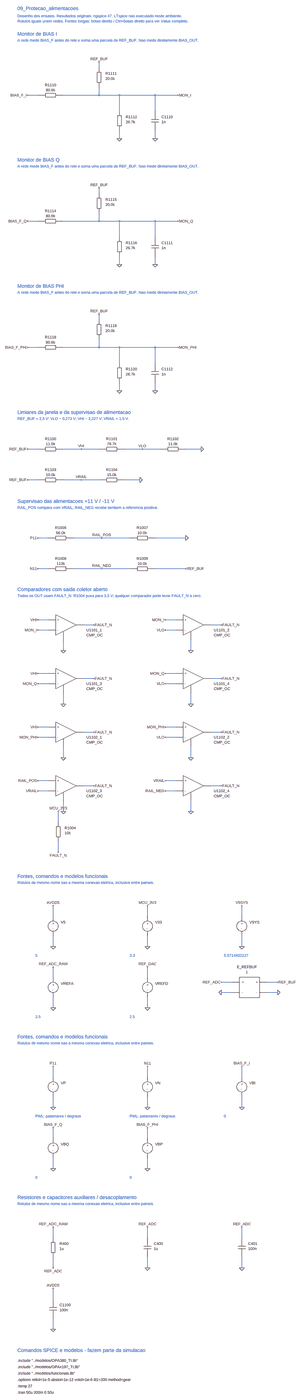
[diagram p0: schematic 09_Protecao_alimentacoes.asc, whole sheet]
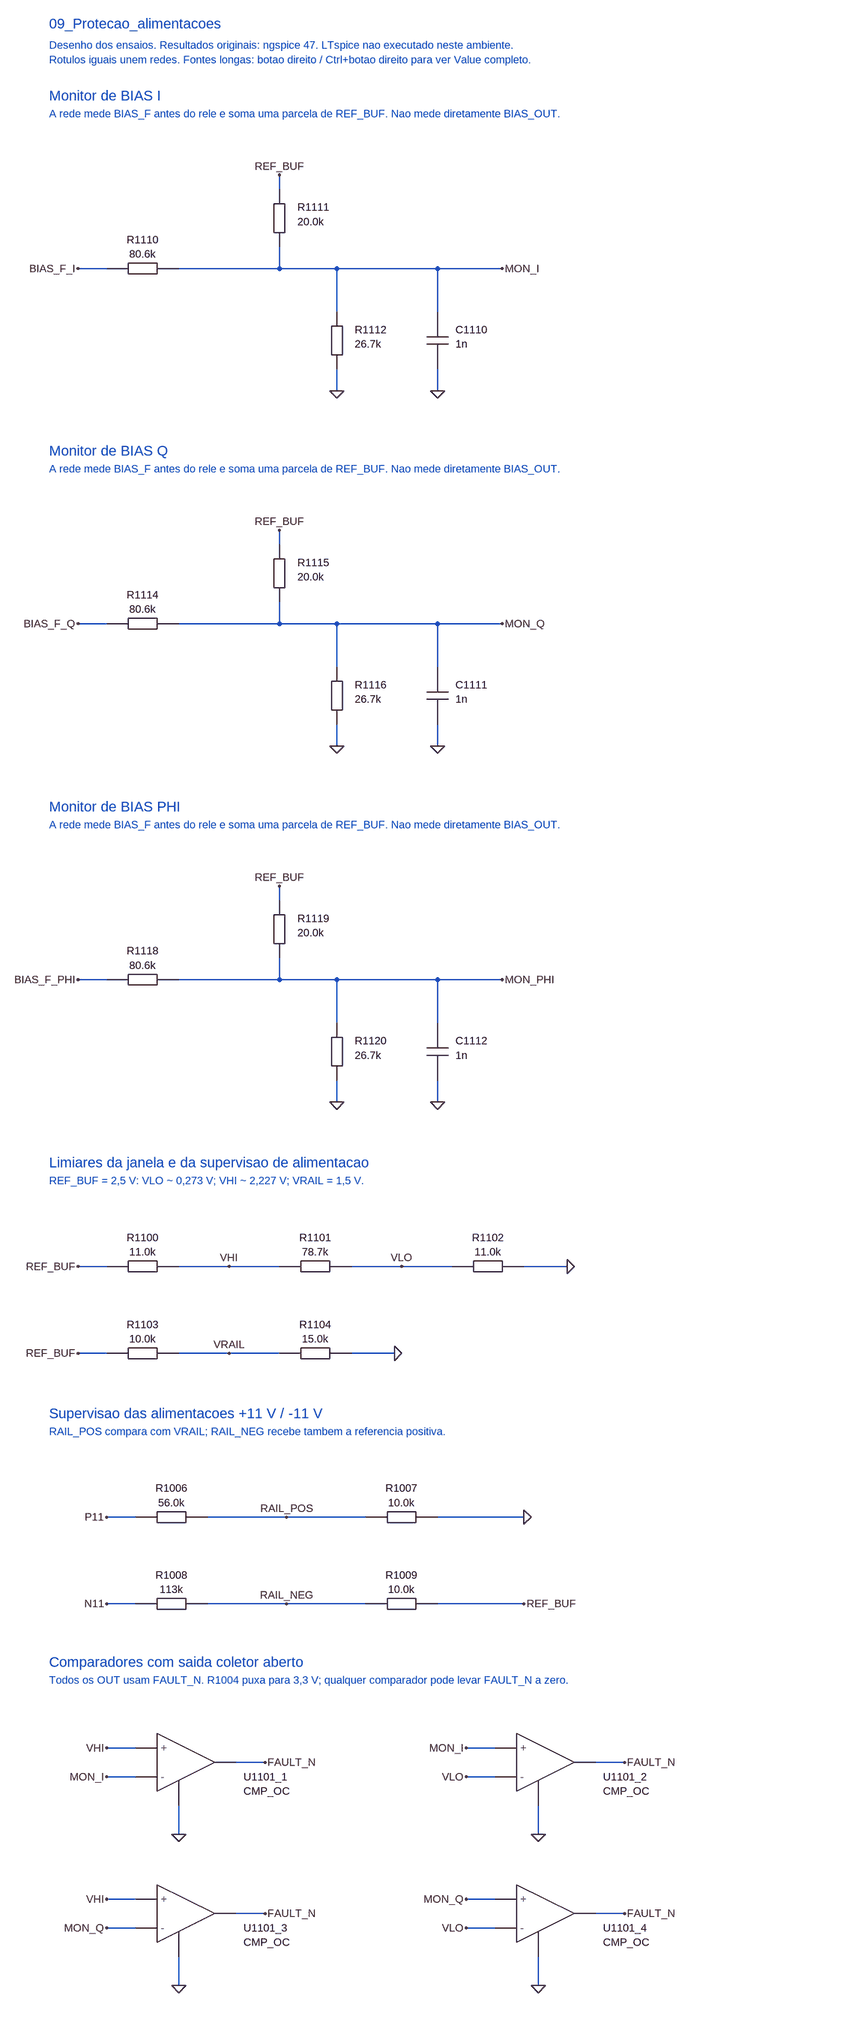
[diagram p1: schematic 09_Protecao_alimentacoes.asc, part, row 1 of 2, column 1 of 1]
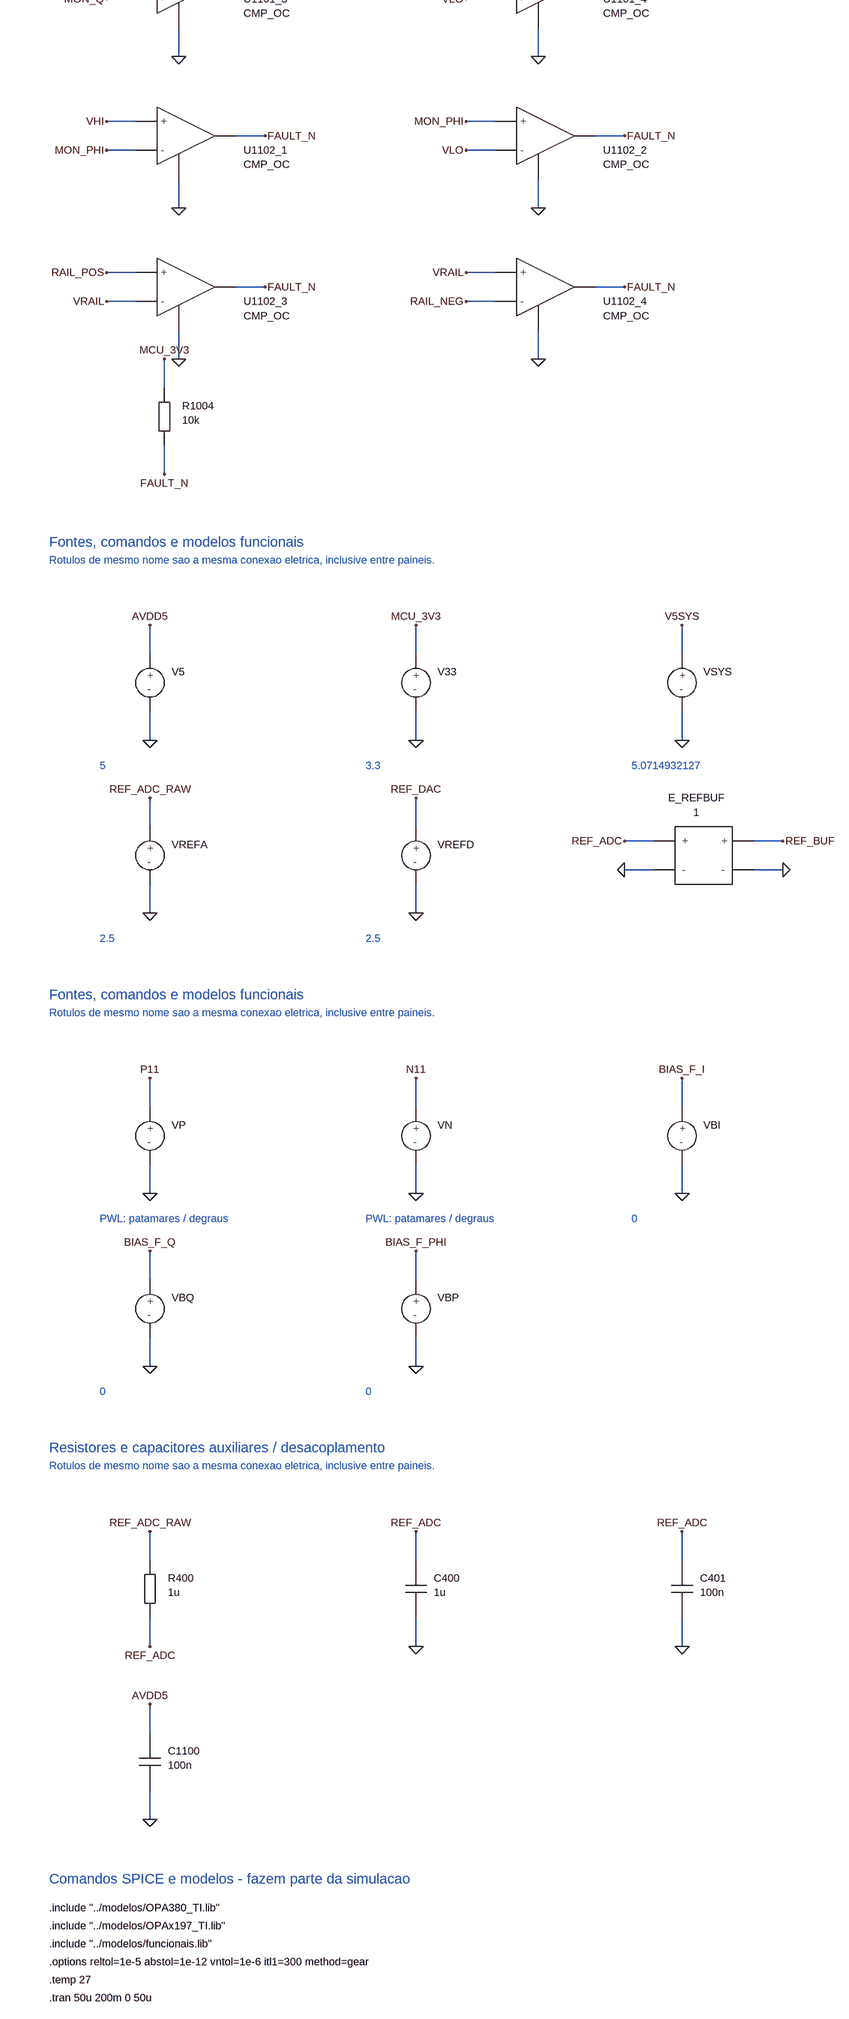
[diagram p2: schematic 09_Protecao_alimentacoes.asc, part, row 2 of 2, column 1 of 1]
09_Protecao_alimentacoes.asc, the LTspice schematic file:
Version 4.1
SHEET 1 1968 10640
TEXT 64 32 Left 3 ;09_Protecao_alimentacoes
TEXT 64 80 Left 2 ;Desenho dos ensaios. Resultados originais: ngspice 47. LTspice nao executado neste ambiente.
TEXT 64 112 Left 2 ;Rotulos iguais unem redes. Fontes longas: botao direito / Ctrl+botao direito para ver Value completo.
TEXT 64 192 Left 3 ;Monitor de BIAS I
TEXT 64 232 Left 2 ;A rede mede BIAS_F antes do rele e soma uma parcela de REF_BUF. Nao mede diretamente BIAS_OUT.
WIRE 192 576 128 576
WIRE 352 576 1072 576
WIRE 576 400 576 368
WIRE 576 528 576 576
WIRE 704 576 704 672
WIRE 704 800 704 848
WIRE 928 576 928 672
WIRE 928 800 928 848
FLAG 128 576 BIAS_F_I
FLAG 1072 576 MON_I
FLAG 576 368 REF_BUF
FLAG 704 848 0
FLAG 928 848 0
SYMBOL CV_RH 192 576 R0
SYMATTR InstName R1110
SYMATTR Value 80.6k
SYMBOL CV_RV 576 400 R0
SYMATTR InstName R1111
SYMATTR Value 20.0k
SYMBOL CV_RV 704 672 R0
SYMATTR InstName R1112
SYMATTR Value 26.7k
SYMBOL CV_CV 928 672 R0
SYMATTR InstName C1110
SYMATTR Value 1n
TEXT 64 1088 Left 3 ;Monitor de BIAS Q
TEXT 64 1128 Left 2 ;A rede mede BIAS_F antes do rele e soma uma parcela de REF_BUF. Nao mede diretamente BIAS_OUT.
WIRE 192 1472 128 1472
WIRE 352 1472 1072 1472
WIRE 576 1296 576 1264
WIRE 576 1424 576 1472
WIRE 704 1472 704 1568
WIRE 704 1696 704 1744
WIRE 928 1472 928 1568
WIRE 928 1696 928 1744
FLAG 128 1472 BIAS_F_Q
FLAG 1072 1472 MON_Q
FLAG 576 1264 REF_BUF
FLAG 704 1744 0
FLAG 928 1744 0
SYMBOL CV_RH 192 1472 R0
SYMATTR InstName R1114
SYMATTR Value 80.6k
SYMBOL CV_RV 576 1296 R0
SYMATTR InstName R1115
SYMATTR Value 20.0k
SYMBOL CV_RV 704 1568 R0
SYMATTR InstName R1116
SYMATTR Value 26.7k
SYMBOL CV_CV 928 1568 R0
SYMATTR InstName C1111
SYMATTR Value 1n
TEXT 64 1984 Left 3 ;Monitor de BIAS PHI
TEXT 64 2024 Left 2 ;A rede mede BIAS_F antes do rele e soma uma parcela de REF_BUF. Nao mede diretamente BIAS_OUT.
WIRE 192 2368 128 2368
WIRE 352 2368 1072 2368
WIRE 576 2192 576 2160
WIRE 576 2320 576 2368
WIRE 704 2368 704 2464
WIRE 704 2592 704 2640
WIRE 928 2368 928 2464
WIRE 928 2592 928 2640
FLAG 128 2368 BIAS_F_PHI
FLAG 1072 2368 MON_PHI
FLAG 576 2160 REF_BUF
FLAG 704 2640 0
FLAG 928 2640 0
SYMBOL CV_RH 192 2368 R0
SYMATTR InstName R1118
SYMATTR Value 80.6k
SYMBOL CV_RV 576 2192 R0
SYMATTR InstName R1119
SYMATTR Value 20.0k
SYMBOL CV_RV 704 2464 R0
SYMATTR InstName R1120
SYMATTR Value 26.7k
SYMBOL CV_CV 928 2464 R0
SYMATTR InstName C1112
SYMATTR Value 1n
TEXT 64 2880 Left 3 ;Limiares da janela e da supervisao de alimentacao
TEXT 64 2920 Left 2 ;REF_BUF = 2,5 V: VLO ~ 0,273 V; VHI ~ 2,227 V; VRAIL = 1,5 V.
WIRE 192 3232 128 3232
WIRE 352 3232 576 3232
WIRE 736 3232 960 3232
WIRE 1120 3232 1216 3232
WIRE 192 3520 128 3520
WIRE 352 3520 576 3520
WIRE 736 3520 832 3520
FLAG 128 3232 REF_BUF
FLAG 464 3232 VHI
FLAG 848 3232 VLO
FLAG 1216 3232 0
FLAG 128 3520 REF_BUF
FLAG 464 3520 VRAIL
FLAG 832 3520 0
SYMBOL CV_RH 192 3232 R0
SYMATTR InstName R1100
SYMATTR Value 11.0k
SYMBOL CV_RH 576 3232 R0
SYMATTR InstName R1101
SYMATTR Value 78.7k
SYMBOL CV_RH 960 3232 R0
SYMATTR InstName R1102
SYMATTR Value 11.0k
SYMBOL CV_RH 192 3520 R0
SYMATTR InstName R1103
SYMATTR Value 10.0k
SYMBOL CV_RH 576 3520 R0
SYMATTR InstName R1104
SYMATTR Value 15.0k
TEXT 64 3904 Left 3 ;Supervisao das alimentacoes +11 V / -11 V
TEXT 64 3944 Left 2 ;RAIL_POS compara com VRAIL; RAIL_NEG recebe tambem a referencia positiva.
WIRE 256 4224 192 4224
WIRE 416 4224 768 4224
WIRE 928 4224 1120 4224
WIRE 256 4480 192 4480
WIRE 416 4480 768 4480
WIRE 928 4480 1120 4480
FLAG 192 4224 P11
FLAG 592 4224 RAIL_POS
FLAG 1120 4224 0
FLAG 192 4480 N11
FLAG 592 4480 RAIL_NEG
FLAG 1120 4480 REF_BUF
SYMBOL CV_RH 256 4224 R0
SYMATTR InstName R1006
SYMATTR Value 56.0k
SYMBOL CV_RH 768 4224 R0
SYMATTR InstName R1007
SYMATTR Value 10.0k
SYMBOL CV_RH 256 4480 R0
SYMATTR InstName R1008
SYMATTR Value 113k
SYMBOL CV_RHR 768 4480 R0
SYMATTR InstName R1009
SYMATTR Value 10.0k
TEXT 64 4800 Left 3 ;Comparadores com saida coletor aberto
TEXT 64 4840 Left 2 ;Todos os OUT usam FAULT_N. R1004 puxa para 3,3 V; qualquer comparador pode levar FAULT_N a zero.
WIRE 256 5152 192 5152
WIRE 256 5216 192 5216
WIRE 480 5184 544 5184
WIRE 352 5280 352 5344
WIRE 1056 5152 992 5152
WIRE 1056 5216 992 5216
WIRE 1280 5184 1344 5184
WIRE 1152 5280 1152 5344
WIRE 256 5488 192 5488
WIRE 256 5552 192 5552
WIRE 480 5520 544 5520
WIRE 352 5616 352 5680
WIRE 1056 5488 992 5488
WIRE 1056 5552 992 5552
WIRE 1280 5520 1344 5520
WIRE 1152 5616 1152 5680
WIRE 256 5824 192 5824
WIRE 256 5888 192 5888
WIRE 480 5856 544 5856
WIRE 352 5952 352 6016
WIRE 1056 5824 992 5824
WIRE 1056 5888 992 5888
WIRE 1280 5856 1344 5856
WIRE 1152 5952 1152 6016
WIRE 256 6160 192 6160
WIRE 256 6224 192 6224
WIRE 480 6192 544 6192
WIRE 352 6288 352 6352
WIRE 1056 6160 992 6160
WIRE 1056 6224 992 6224
WIRE 1280 6192 1344 6192
WIRE 1152 6288 1152 6352
WIRE 320 6416 320 6352
WIRE 320 6544 320 6608
FLAG 192 5152 VHI
FLAG 192 5216 MON_I
FLAG 544 5184 FAULT_N
FLAG 352 5344 0
FLAG 992 5152 MON_I
FLAG 992 5216 VLO
FLAG 1344 5184 FAULT_N
FLAG 1152 5344 0
FLAG 192 5488 VHI
FLAG 192 5552 MON_Q
FLAG 544 5520 FAULT_N
FLAG 352 5680 0
FLAG 992 5488 MON_Q
FLAG 992 5552 VLO
FLAG 1344 5520 FAULT_N
FLAG 1152 5680 0
FLAG 192 5824 VHI
FLAG 192 5888 MON_PHI
FLAG 544 5856 FAULT_N
FLAG 352 6016 0
FLAG 992 5824 MON_PHI
FLAG 992 5888 VLO
FLAG 1344 5856 FAULT_N
FLAG 1152 6016 0
FLAG 192 6160 RAIL_POS
FLAG 192 6224 VRAIL
FLAG 544 6192 FAULT_N
FLAG 352 6352 0
FLAG 992 6160 VRAIL
FLAG 992 6224 RAIL_NEG
FLAG 1344 6192 FAULT_N
FLAG 1152 6352 0
FLAG 320 6352 MCU_3V3
FLAG 320 6608 FAULT_N
SYMBOL CV_CMP 320 5120 R0
SYMATTR InstName U1101_1
SYMATTR Value CMP_OC
SYMBOL CV_CMP 1120 5120 R0
SYMATTR InstName U1101_2
SYMATTR Value CMP_OC
SYMBOL CV_CMP 320 5456 R0
SYMATTR InstName U1101_3
SYMATTR Value CMP_OC
SYMBOL CV_CMP 1120 5456 R0
SYMATTR InstName U1101_4
SYMATTR Value CMP_OC
SYMBOL CV_CMP 320 5792 R0
SYMATTR InstName U1102_1
SYMATTR Value CMP_OC
SYMBOL CV_CMP 1120 5792 R0
SYMATTR InstName U1102_2
SYMATTR Value CMP_OC
SYMBOL CV_CMP 320 6128 R0
SYMATTR InstName U1102_3
SYMATTR Value CMP_OC
SYMBOL CV_CMP 1120 6128 R0
SYMATTR InstName U1102_4
SYMATTR Value CMP_OC
SYMBOL CV_RV 320 6416 R0
SYMATTR InstName R1004
SYMATTR Value 10k
TEXT 64 6784 Left 3 ;Fontes, comandos e modelos funcionais
TEXT 64 6824 Left 2 ;Rotulos de mesmo nome sao a mesma conexao eletrica, inclusive entre paineis.
WIRE 288 7104 288 7040
WIRE 288 7232 288 7296
WIRE 880 7104 880 7040
WIRE 880 7232 880 7296
WIRE 1472 7104 1472 7040
WIRE 1472 7232 1472 7296
WIRE 288 7488 288 7424
WIRE 288 7616 288 7680
WIRE 880 7488 880 7424
WIRE 880 7616 880 7680
WIRE 1632 7520 1696 7520
WIRE 1632 7584 1696 7584
WIRE 1408 7520 1344 7520
WIRE 1408 7584 1344 7584
FLAG 288 7040 AVDD5
FLAG 288 7296 0
FLAG 880 7040 MCU_3V3
FLAG 880 7296 0
FLAG 1472 7040 V5SYS
FLAG 1472 7296 0
FLAG 288 7424 REF_ADC_RAW
FLAG 288 7680 0
FLAG 880 7424 REF_DAC
FLAG 880 7680 0
FLAG 1696 7520 REF_BUF
FLAG 1696 7584 0
FLAG 1344 7520 REF_ADC
FLAG 1344 7584 0
SYMBOL CV_V 288 7104 R0
SYMATTR InstName V5
SYMATTR Value 5
SYMBOL CV_V 880 7104 R0
SYMATTR InstName V33
SYMATTR Value 3.3
SYMBOL CV_V 1472 7104 R0
SYMATTR InstName VSYS
SYMATTR Value 5.0714932127
SYMBOL CV_V 288 7488 R0
SYMATTR InstName VREFA
SYMATTR Value 2.5
SYMBOL CV_V 880 7488 R0
SYMATTR InstName VREFD
SYMATTR Value 2.5
SYMBOL CV_E 1472 7488 R0
SYMATTR InstName E_REFBUF
SYMATTR Value 1
TEXT 176 7352 Left 2 ;5
TEXT 768 7352 Left 2 ;3.3
TEXT 1360 7352 Left 2 ;5.0714932127
TEXT 176 7736 Left 2 ;2.5
TEXT 768 7736 Left 2 ;2.5
TEXT 64 7936 Left 3 ;Fontes, comandos e modelos funcionais
TEXT 64 7976 Left 2 ;Rotulos de mesmo nome sao a mesma conexao eletrica, inclusive entre paineis.
WIRE 288 8256 288 8192
WIRE 288 8384 288 8448
WIRE 880 8256 880 8192
WIRE 880 8384 880 8448
WIRE 1472 8256 1472 8192
WIRE 1472 8384 1472 8448
WIRE 288 8640 288 8576
WIRE 288 8768 288 8832
WIRE 880 8640 880 8576
WIRE 880 8768 880 8832
FLAG 288 8192 P11
FLAG 288 8448 0
FLAG 880 8192 N11
FLAG 880 8448 0
FLAG 1472 8192 BIAS_F_I
FLAG 1472 8448 0
FLAG 288 8576 BIAS_F_Q
FLAG 288 8832 0
FLAG 880 8576 BIAS_F_PHI
FLAG 880 8832 0
SYMBOL CV_V 288 8256 R0
SYMATTR InstName VP
SYMATTR Value PWL(0 11 50m 11 80m 8 110m 11 200m 11)
SYMBOL CV_V 880 8256 R0
SYMATTR InstName VN
SYMATTR Value PWL(0 -11 120m -11 150m -8 180m -11 200m -11)
SYMBOL CV_V 1472 8256 R0
SYMATTR InstName VBI
SYMATTR Value 0
SYMBOL CV_V 288 8640 R0
SYMATTR InstName VBQ
SYMATTR Value 0
SYMBOL CV_V 880 8640 R0
SYMATTR InstName VBP
SYMATTR Value 0
TEXT 176 8504 Left 2 ;PWL: patamares / degraus
TEXT 768 8504 Left 2 ;PWL: patamares / degraus
TEXT 1360 8504 Left 2 ;0
TEXT 176 8888 Left 2 ;0
TEXT 768 8888 Left 2 ;0
TEXT 64 9088 Left 3 ;Resistores e capacitores auxiliares / desacoplamento
TEXT 64 9128 Left 2 ;Rotulos de mesmo nome sao a mesma conexao eletrica, inclusive entre paineis.
WIRE 288 9408 288 9344
WIRE 288 9536 288 9600
WIRE 880 9408 880 9344
WIRE 880 9536 880 9600
WIRE 1472 9408 1472 9344
WIRE 1472 9536 1472 9600
WIRE 288 9792 288 9728
WIRE 288 9920 288 9984
FLAG 288 9344 REF_ADC_RAW
FLAG 288 9600 REF_ADC
FLAG 880 9344 REF_ADC
FLAG 880 9600 0
FLAG 1472 9344 REF_ADC
FLAG 1472 9600 0
FLAG 288 9728 AVDD5
FLAG 288 9984 0
SYMBOL CV_RV 288 9408 R0
SYMATTR InstName R400
SYMATTR Value 1u
SYMBOL CV_CV 880 9408 R0
SYMATTR InstName C400
SYMATTR Value 1u
SYMBOL CV_CV 1472 9408 R0
SYMATTR InstName C401
SYMATTR Value 100n
SYMBOL CV_CV 288 9792 R0
SYMATTR InstName C1100
SYMATTR Value 100n
TEXT 64 10240 Left 3 ;Comandos SPICE e modelos - fazem parte da simulacao
TEXT 64 10304 Left 2 !.include "../modelos/OPA380_TI.lib"
TEXT 64 10344 Left 2 !.include "../modelos/OPAx197_TI.lib"
TEXT 64 10384 Left 2 !.include "../modelos/funcionais.lib"
TEXT 64 10424 Left 2 !.options reltol=1e-5 abstol=1e-12 vntol=1e-6 itl1=300 method=gear
TEXT 64 10464 Left 2 !.temp 27
TEXT 64 10504 Left 2 !.tran 50u 200m 0 50u

The netlist it stands for:
* 09_Protecao_alimentacoes.asc
R1110 BIAS_F_I MON_I 80.6k
R1111 REF_BUF MON_I 20.0k
R1112 MON_I 0 26.7k
C1110 MON_I 0 1n
R1114 BIAS_F_Q MON_Q 80.6k
R1115 REF_BUF MON_Q 20.0k
R1116 MON_Q 0 26.7k
C1111 MON_Q 0 1n
R1118 BIAS_F_PHI MON_PHI 80.6k
R1119 REF_BUF MON_PHI 20.0k
R1120 MON_PHI 0 26.7k
C1112 MON_PHI 0 1n
R1100 REF_BUF VHI 11.0k
R1101 VHI VLO 78.7k
R1102 VLO 0 11.0k
R1103 REF_BUF VRAIL 10.0k
R1104 VRAIL 0 15.0k
R1006 P11 RAIL_POS 56.0k
R1007 RAIL_POS 0 10.0k
R1008 N11 RAIL_NEG 113k
R1009 REF_BUF RAIL_NEG 10.0k
X§U1101_1 VHI MON_I FAULT_N 0 CMP_OC  ; pins + - OUT G
X§U1101_2 MON_I VLO FAULT_N 0 CMP_OC  ; pins + - OUT G
X§U1101_3 VHI MON_Q FAULT_N 0 CMP_OC  ; pins + - OUT G
X§U1101_4 MON_Q VLO FAULT_N 0 CMP_OC  ; pins + - OUT G
X§U1102_1 VHI MON_PHI FAULT_N 0 CMP_OC  ; pins + - OUT G
X§U1102_2 MON_PHI VLO FAULT_N 0 CMP_OC  ; pins + - OUT G
X§U1102_3 RAIL_POS VRAIL FAULT_N 0 CMP_OC  ; pins + - OUT G
X§U1102_4 VRAIL RAIL_NEG FAULT_N 0 CMP_OC  ; pins + - OUT G
R1004 MCU_3V3 FAULT_N 10k
V5 AVDD5 0 5
V33 MCU_3V3 0 3.3
VSYS V5SYS 0 5.0714932127
VREFA REF_ADC_RAW 0 2.5
VREFD REF_DAC 0 2.5
E_REFBUF REF_BUF 0 REF_ADC 0 1
VP P11 0 PWL(0 11 50m 11 80m 8 110m 11 200m 11)
VN N11 0 PWL(0 -11 120m -11 150m -8 180m -11 200m -11)
VBI BIAS_F_I 0 0
VBQ BIAS_F_Q 0 0
VBP BIAS_F_PHI 0 0
R400 REF_ADC_RAW REF_ADC 1u
C400 REF_ADC 0 1u
C401 REF_ADC 0 100n
C1100 AVDD5 0 100n
* 09_Protecao_alimentacoes
* Desenho dos ensaios. Resultados originais: ngspice 47. LTspice nao executado neste ambiente.
* Rotulos iguais unem redes. Fontes longas: botao direito / Ctrl+botao direito para ver Value completo.
* Monitor de BIAS I
* A rede mede BIAS_F antes do rele e soma uma parcela de REF_BUF. Nao mede diretamente BIAS_OUT.
* Monitor de BIAS Q
* A rede mede BIAS_F antes do rele e soma uma parcela de REF_BUF. Nao mede diretamente BIAS_OUT.
* Monitor de BIAS PHI
* A rede mede BIAS_F antes do rele e soma uma parcela de REF_BUF. Nao mede diretamente BIAS_OUT.
* Limiares da janela e da supervisao de alimentacao
* REF_BUF = 2,5 V: VLO ~ 0,273 V; VHI ~ 2,227 V; VRAIL = 1,5 V.
* Supervisao das alimentacoes +11 V / -11 V
* RAIL_POS compara com VRAIL; RAIL_NEG recebe tambem a referencia positiva.
* Comparadores com saida coletor aberto
* Todos os OUT usam FAULT_N. R1004 puxa para 3,3 V; qualquer comparador pode levar FAULT_N a zero.
* Fontes, comandos e modelos funcionais
* Rotulos de mesmo nome sao a mesma conexao eletrica, inclusive entre paineis.
* 5
* 3.3
* 5.0714932127
* 2.5
* 2.5
* Fontes, comandos e modelos funcionais
* Rotulos de mesmo nome sao a mesma conexao eletrica, inclusive entre paineis.
* PWL: patamares / degraus
* PWL: patamares / degraus
* 0
* 0
* 0
* Resistores e capacitores auxiliares / desacoplamento
* Rotulos de mesmo nome sao a mesma conexao eletrica, inclusive entre paineis.
* Comandos SPICE e modelos - fazem parte da simulacao
.include "../modelos/OPA380_TI.lib"
.include "../modelos/OPAx197_TI.lib"
.include "../modelos/funcionais.lib"
.options reltol=1e-5 abstol=1e-12 vntol=1e-6 itl1=300 method=gear
.temp 27
.tran 50u 200m 0 50u
.backanno
.end